# Altium schematic sheet Top-Sheet.SchDoc
size A4; SheetNumber: 1; SheetTotal: 6
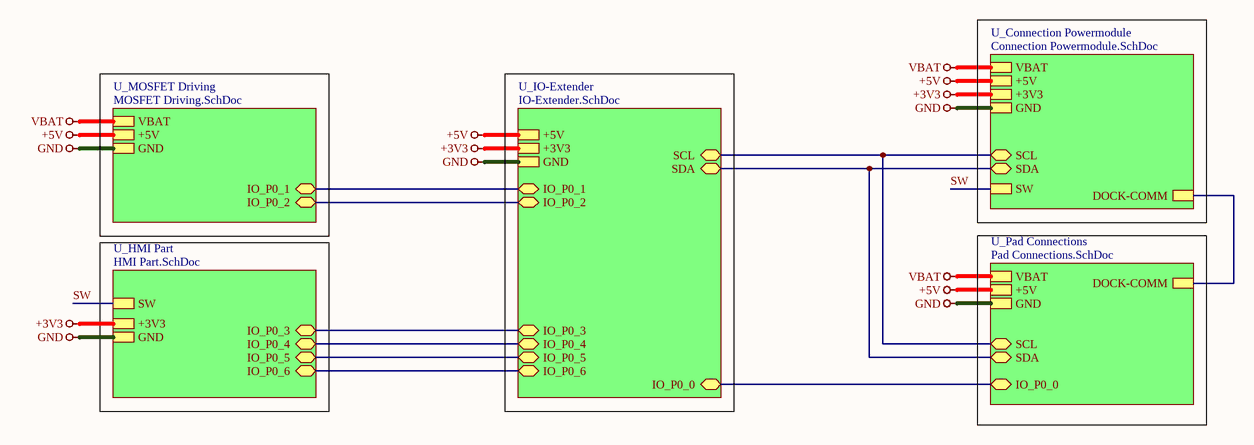
[diagram p0: Top-Sheet.SchDoc]

## Sub-sheets
U_Connection Powermodule = Connection Powermodule.SchDoc: VBAT, +5V, GND, SCL (bidir), SDA (bidir), SW, DOCK-COMM, +3V3
U_HMI Part = HMI Part.SchDoc: SW, IO_P0_3 (bidir), IO_P0_4 (bidir), IO_P0_5 (bidir), IO_P0_6 (bidir), +3V3, GND
U_IO-Extender = IO-Extender.SchDoc: GND, +5V, SCL (bidir), SDA (bidir), IO_P0_0 (bidir), IO_P0_1 (bidir), IO_P0_2 (bidir), IO_P0_3 (bidir), IO_P0_4 (bidir), IO_P0_5 (bidir), IO_P0_6 (bidir), +3V3
U_MOSFET Driving = MOSFET Driving.SchDoc: VBAT, +5V, GND, IO_P0_1 (bidir), IO_P0_2 (bidir)
U_Pad Connections = Pad Connections.SchDoc: VBAT, +5V, GND, SCL (bidir), SDA (bidir), IO_P0_0 (bidir), DOCK-COMM

## Nets
+3V3: sheet U_IO-Extender/+3V3, sheet U_Connection Powermodule/+3V3, sheet U_HMI Part/+3V3
+5V: sheet U_IO-Extender/+5V, sheet U_Connection Powermodule/+5V, sheet U_Pad Connections/+5V, sheet U_MOSFET Driving/+5V
GND: sheet U_IO-Extender/GND, sheet U_Connection Powermodule/GND, sheet U_HMI Part/GND, sheet U_Pad Connections/GND, sheet U_MOSFET Driving/GND
VBAT: sheet U_Connection Powermodule/VBAT, sheet U_Pad Connections/VBAT, sheet U_MOSFET Driving/VBAT
SW: sheet U_Connection Powermodule/SW, sheet U_HMI Part/SW
(unnamed): sheet U_IO-Extender/SCL, sheet U_Connection Powermodule/SCL, sheet U_Pad Connections/SCL
(unnamed): sheet U_IO-Extender/SDA, sheet U_Connection Powermodule/SDA, sheet U_Pad Connections/SDA
(unnamed): sheet U_IO-Extender/IO_P0_0, sheet U_Pad Connections/IO_P0_0
(unnamed): sheet U_IO-Extender/IO_P0_1, sheet U_MOSFET Driving/IO_P0_1
(unnamed): sheet U_IO-Extender/IO_P0_2, sheet U_MOSFET Driving/IO_P0_2
(unnamed): sheet U_IO-Extender/IO_P0_3, sheet U_HMI Part/IO_P0_3
(unnamed): sheet U_IO-Extender/IO_P0_4, sheet U_HMI Part/IO_P0_4
(unnamed): sheet U_IO-Extender/IO_P0_5, sheet U_HMI Part/IO_P0_5
(unnamed): sheet U_IO-Extender/IO_P0_6, sheet U_HMI Part/IO_P0_6
(unnamed): sheet U_Connection Powermodule/DOCK-COMM, sheet U_Pad Connections/DOCK-COMM

## Notes on the sheet
- File:
- Title:
- Date:
- Page
- Num:
- Total:
- Drawn By: Huzaifa Ali